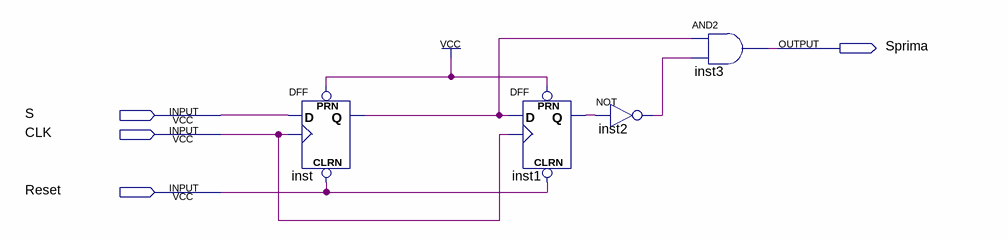
[diagram p0: schematic sheet]
// Quartus schematic GeneradorPrimas.bdf as structural Verilog: 4 symbols, 4 pins
module GeneradorPrimas (
  input  S,
  input  CLK,
  input  Reset,
  output Sprima
);

  wire inst1_q, inst2_out, inst_q;

  DFF inst (.CLRN(Reset), .CLK(CLK), .D(S), .PRN(1'b1), .Q(inst_q));
  DFF inst1 (.CLRN(Reset), .CLK(CLK), .D(inst_q), .PRN(1'b1), .Q(inst1_q));
  not inst2 (inst2_out, inst1_q);
  and inst3 (Sprima, inst_q, inst2_out);
endmodule
